# Altium schematic sheet 5V,_3V3,_6a,_Batt.SchDoc
size A4; SheetNumber: 6; SheetTotal: 9
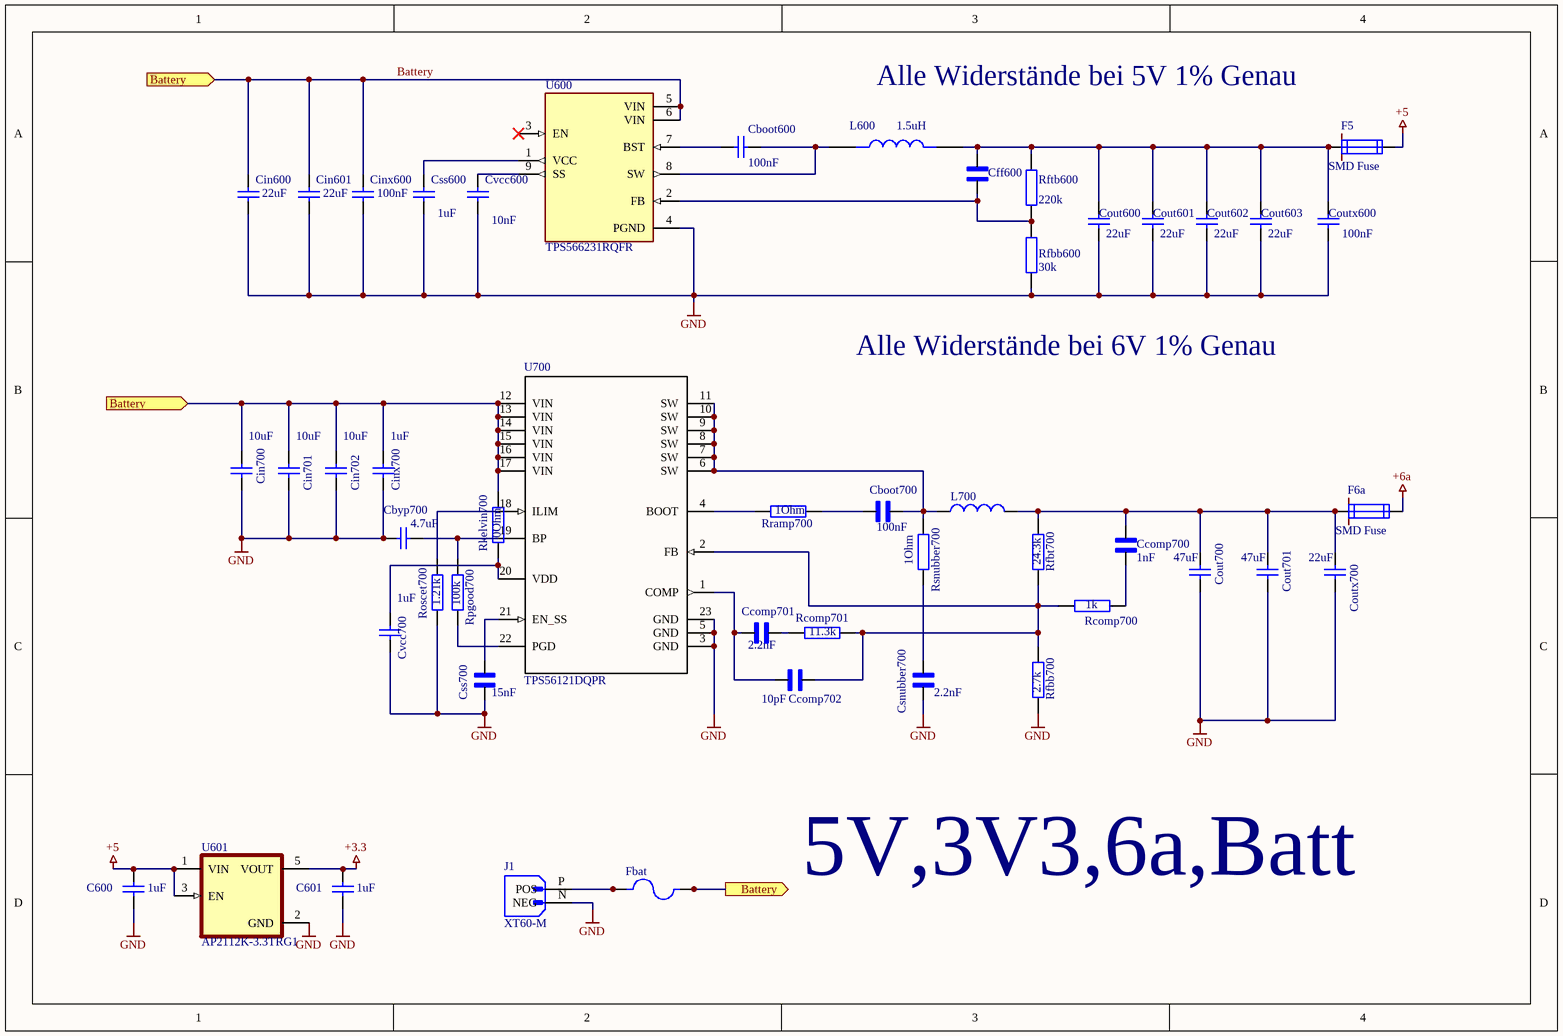
[diagram p0: 5V,_3V3,_6a,_Batt.SchDoc]

## Parts
C600  value 1uF  [0603]  (hidden comment: 0603)
C601  value 1uF  [0603]  (hidden comment: 0603)
Cboot600  value 100nF  [0603]  (hidden comment: 1% 0603)
Cboot700  value 100nF  [CAPC1005X61N]  (hidden comment: 1% 0402)
Cbyp700  value 4.7uF  [0603]  (hidden comment: 1% 0603)
Ccomp700  value 1nF  [CAPC1005X61N]  (hidden comment: 1% 0402)
Ccomp701  value 2.2nF  [CAPC1005X61N]  (hidden comment: 1% 0402)
Ccomp702  value 10pF  [CAPC1005X61N]  (hidden comment: 1% 0402)
Cff600  1% 0402  [CAPC1005X61N]  (value not drawn)
Cin600  value 22uF  [0603]  (hidden comment: 1% 0603)
Cin601  value 22uF  [0603]  (hidden comment: 1% 0603)
Cin700  value 10uF  [0603]  (hidden comment: 1% 0603)
Cin701  value 10uF  [0603]  (hidden comment: 1% 0603)
Cin702  value 10uF  [0603]  (hidden comment: 1% 0603)
Cinx600  value 100nF  [0603]  (hidden comment: 1% 0603)
Cinx700  value 1uF  [0603]  (hidden comment: 1% 0603)
Cout600  value 22uF  [0603]  (hidden comment: 1% 0603)
Cout601  value 22uF  [0603]  (hidden comment: 1% 0603)
Cout602  value 22uF  [0603]  (hidden comment: 1% 0603)
Cout603  value 22uF  [0603]  (hidden comment: 1% 0603)
Cout700  value 47uF  [0603]  (hidden comment: 1% 0603)
Cout701  value 47uF  [0603]  (hidden comment: 1% 0603)
Coutx600  value 100nF  [0603]  (hidden comment: 1% 0603)
Coutx700  value 22uF  [0603]  (hidden comment: 1% 0603)
Csnubber700  value 2.2nF  [CAPC1005X61N]  (hidden comment: 1% 0402)
Css600  value 1uF  [0603]  (hidden comment: 1% 0603)
Css700  value 15nF  [CAPC1005X61N]  (hidden comment: 1% 0402)
Cvcc600  value 10nF  [0603]  (hidden comment: 1% 0603)
Cvcc700  value 1uF  [0603]  (hidden comment: 1% 0603)
F5  SMD Fuse  [1206]
F6a  SMD Fuse  [1206]
Fbat  3557-15  [FUSE_3557-15]  (value not drawn)
J1  XT60-M  [AMASS_XT60-M]
L600  value 1.5uH  [IND_SPM6530T-1R5M100]  (hidden comment: Spule)
L700  (no value)  [WE-HCC_807021]
Rcomp700  value 1k  [0603]  (hidden comment: 1% 0603)
Rcomp701  value 11.3k  [0603]  (hidden comment: 1% 0603)
Rfbb600  value 30k  [0603]  (hidden comment: 1% 0603)
Rfbb700  value 2.7k  [0603]  (hidden comment: 1% 0603)
Rfbt700  value 24.3k  [0603]  (hidden comment: 1% 0603)
Rftb600  value 220k  [0603]  (hidden comment: 1% 0603)
Rkelvin700  value 0Ohm  [0603]  (hidden comment: 1% 0603)
Roscet700  value 1.21k  [0603]  (hidden comment: 1% 0603)
Rpgood700  value 100k  [0603]  (hidden comment: 1% 0603)
Rramp700  value 1Ohm  [0603]  (hidden comment: 1% 0603)
Rsnubber700  value 1Ohm  [0603]  (hidden comment: 1% 0603)
U600  TPS566231RQFR  [IC_TPS566231RQFR]
U601  AP2112K-3.3TRG1  [SOT95P285X140-5N]
U700  TPS56121DQPR  [DQP0022A]

## Ports
Battery (in, see 5V,_3V3,_6a,_Batt[1A], 5V,_3V3,_6a,_Batt[2D], 6b,_6c[1A], 6b,_6c[1C], Test_Sensor_Connectoren[2C]), Battery (in, see 5V,_3V3,_6a,_Batt[1B], 5V,_3V3,_6a,_Batt[2D], 6b,_6c[1A], 6b,_6c[1C], Test_Sensor_Connectoren[2C]), Battery (out, see 5V,_3V3,_6a,_Batt[1A], 5V,_3V3,_6a,_Batt[1B], 6b,_6c[1A], 6b,_6c[1C], Test_Sensor_Connectoren[2C])

## Nets
+3.3: C601.2 U601.5(VOUT)
+5: C600.2 F5.2 U601.1(VIN) U601.3(EN)
+6a: F6a.2
GND: C600.1 C601.1 Cbyp700.2 Cin600.1 Cin601.1 Cin700.2 Cin701.2 Cin702.2 Cinx600.1 Cinx700.2 Cout600.2 Cout601.2 Cout602.2 Cout603.2 Cout700.2 Cout701.2 Coutx600.2 Coutx700.2 Csnubber700.1 Css600.2 Css700.1 Cvcc600.2 Cvcc700.2 J1.N(NEG) Rfbb600.1 Rfbb700.1 Roscet700.2 U600.4(PGND) U601.2(GND) U700.3(GND) U700.5(GND) U700.23(GND)
Battery: Cin600.2 Cin601.2 Cin700.1 Cin701.1 Cin702.1 Cinx600.2 Cinx700.1 Fbat.2_1 Fbat.2_2 Rkelvin700.2 U600.5(VIN) U600.6(VIN) U700.12(VIN) U700.13(VIN) U700.14(VIN) U700.15(VIN) U700.16(VIN) U700.17(VIN) ; port Battery
NetCboot600_1: Cboot600.1 U600.7(BST)
NetCboot600_2: Cboot600.2 L600.1 U600.8(SW)
NetCboot700_1: Cboot700.1 L700.1 Rsnubber700.2 U700.6(SW) U700.7(SW) U700.8(SW) U700.9(SW) U700.10(SW) U700.11(SW)
NetCboot700_2: Cboot700.2 Rramp700.2
NetCbyp700_1: Cbyp700.1 Rpgood700.1 U700.19(BP)
NetCcomp700_1: Ccomp700.1 Rcomp700.1
NetCcomp700_2: Ccomp700.2 Cout700.1 Cout701.1 Coutx700.1 F6a.1 L700.2 Rfbt700.2
NetCcomp701_1: Ccomp701.1 Ccomp702.1 U700.1(COMP)
NetCcomp701_2: Ccomp701.2 Rcomp701.1
NetCcomp702_2: Ccomp702.2 Rcomp700.2 Rcomp701.2 Rfbb700.2 Rfbt700.1 U700.2(FB)
NetCff600_1: Cff600.1 Cout600.1 Cout601.1 Cout602.1 Cout603.1 Coutx600.1 F5.1 L600.2 Rftb600.2
NetCff600_2: Cff600.2 Rfbb600.2 Rftb600.1 U600.2(FB)
NetCsnubber700_2: Csnubber700.2 Rsnubber700.1
NetCss600_1: Css600.1 U600.1(VCC)
NetCss700_2: Css700.2 U700.21(EN_SS)
NetCvcc600_1: Cvcc600.1 U600.9(SS)
NetCvcc700_1: Cvcc700.1 Rkelvin700.1 U700.20(VDD)
NetFbat_1_1: Fbat.1_1 Fbat.1_2 J1.P(POS)
NetRoscet700_1: Roscet700.1 U700.18(ILIM)
NetRpgood700_2: Rpgood700.2 U700.22(PGD)
NetRramp700_1: Rramp700.1 U700.4(BOOT)

Not connected (* = marked no-connect by the designer): U600 3(EN)*

## Notes on the sheet
- Alle Widerstände bei 5V 1% Genau
- Alle Widerstände bei 6V 1% Genau
- 5V,3V3,6a,Batt

## Library data of the parts
C600 C601 Cboot600 Cbyp700 Cin600 Cin601 Cin700-Cin702 Cinx600 Cinx700 Cout600-Cout603 Cout700 Cout701 Coutx600 Coutx700 Css600 Cvcc600 Cvcc700 = KO: Kondensator
Cboot700 Ccomp700-Ccomp702 Csnubber700 Css700 = VJ0402D100KXCAP: Kondensator; Package: None; Price: None; MP: VJ0402D100KXCAP; Availability: Unavailable
Cff600 = VJ0402D100KXCAP: Kondensator; Value: 33pF; Package: None; Price: None; MP: VJ0402D100KXCAP; Availability: Unavailable
F5 = SICHERUNG: SMD Fuse / Voltage rating >6V / Current 7.5A / 1206; Text Field1: Strom
F6a = SICHERUNG: SMD Fuse / Voltage rating >6V / Current 12,5A / 1206; Text Field1: Strom
Fbat = 3557-15: Auto Fuse Holder; THM; Insulated Clip; 30 Amp; Blue | Keystone Electronics 3557-15; SnapEDA_Link: https://www.snapeda.com/parts/3557-15/Keystone/view-part/?ref=snap; Package: None; Value: *; MF: Keystone Electronics; MP: 3557-15; Check_prices: https://www.snapeda.com/parts/3557-15/Keystone/view-part/?ref=eda
J1 = XT60-M: Plug; DC supply; XT60; male; PIN: 2; for cable; soldered; 30A; 500V; MF: AMASS; SnapEDA_Link: https://www.snapeda.com/parts/XT60-M/AMASS/view-part/?ref=snap; Package: Package; Value: *; MP: XT60-M; Check_prices: https://www.snapeda.com/parts/XT60-M/AMASS/view-part/?ref=eda
L600 = SPM6530T-1R5M100: 1.5µH Shielded Drum Core, Wirewound Inductor 11 A 10.67mOhm Max Nonstandard; MF: TDK; Digi-Key_Part_Number: 445-3881-2-ND; Check_prices: https://www.snapeda.com/parts/SPM6530T-1R5M100/TDK/view-part/?ref=eda; Package: NON STANDARD-2 TDK; SnapEDA_Link: https://www.snapeda.com/parts/SPM6530T-1R5M100/TDK/view-part/?ref=snap; MP: SPM6530T-1R5M100; Purchase-URL: https://pricing.snapeda.com/search/part/SPM6530T-1R5M100/?ref=eda
L700 = 7443340220: 7443340220 - Würth; Manufacturer_Name: Wurth Elektronik; Datasheet Link: https://www.we-online.com/components/products/download/3D_WE-HCC-8070_7443340xxx_3D+%28rev1%29.pdf; Height: 7.2mm; Manufacturer_Part_Number: 7443340220; Mouser Part Number: 710-7443340220; Mouser Price/Stock: https://www.mouser.co.uk/ProductDetail/Wurth-Elektronik/7443340220?qs=MVRUG6Lt7nGtb48EAN9JeA%3D%3D
Rcomp700 Rcomp701 Rfbb600 Rfbb700 Rfbt700 Rftb600 Rkelvin700 Roscet700 Rpgood700 Rramp700 Rsnubber700 = RES: Widerstand
U600 = TPS566231RQFR: Wandler IC; MF: {'manufacturer': u'Texas Instruments'}; Package: None; Price: None; Value: *; MP: TPS566231RQFR; Availability: Unavailable
U601 = AP2112K-3.3TRG1: Linear Voltage Regulator IC Positive Fixed 1 Output 600mA SOT-25; MF: Diodes Inc.; Value: *; Purchase-URL: https://pricing.snapeda.com/search/part/AP2112K-3.3TRG1/?ref=eda; Package: SOT-753 Diodes Inc.; Availability: In Stock; Check_prices: https://www.snapeda.com/parts/AP2112K-3.3TRG1/Diodes+Inc./view-part/?ref=eda; Price: None; SnapEDA_Link: https://www.snapeda.com/parts/AP2112K-3.3TRG1/Diodes+Inc./view-part/?ref=snap; MP: AP2112K-3.3TRG1
U700 = TPS56121DQPR: Wandler IC; Manufacturer: Texas Instruments; PartNumber: TPS56121DQPR; RefDes: RefDes; TYPE: TYPE; Manufacturer_Part_Number: TPS56121DQPR; Manufacturer_Name: Texas Instruments; Copyright: Copyright (C) 2018 Accelerated Designs. All rights reserved